# Altium schematic sheet GNSS_ZED-X20P.SchDoc
size A4; DocumentNumber: 2; SheetNumber: 2; SheetTotal: 12
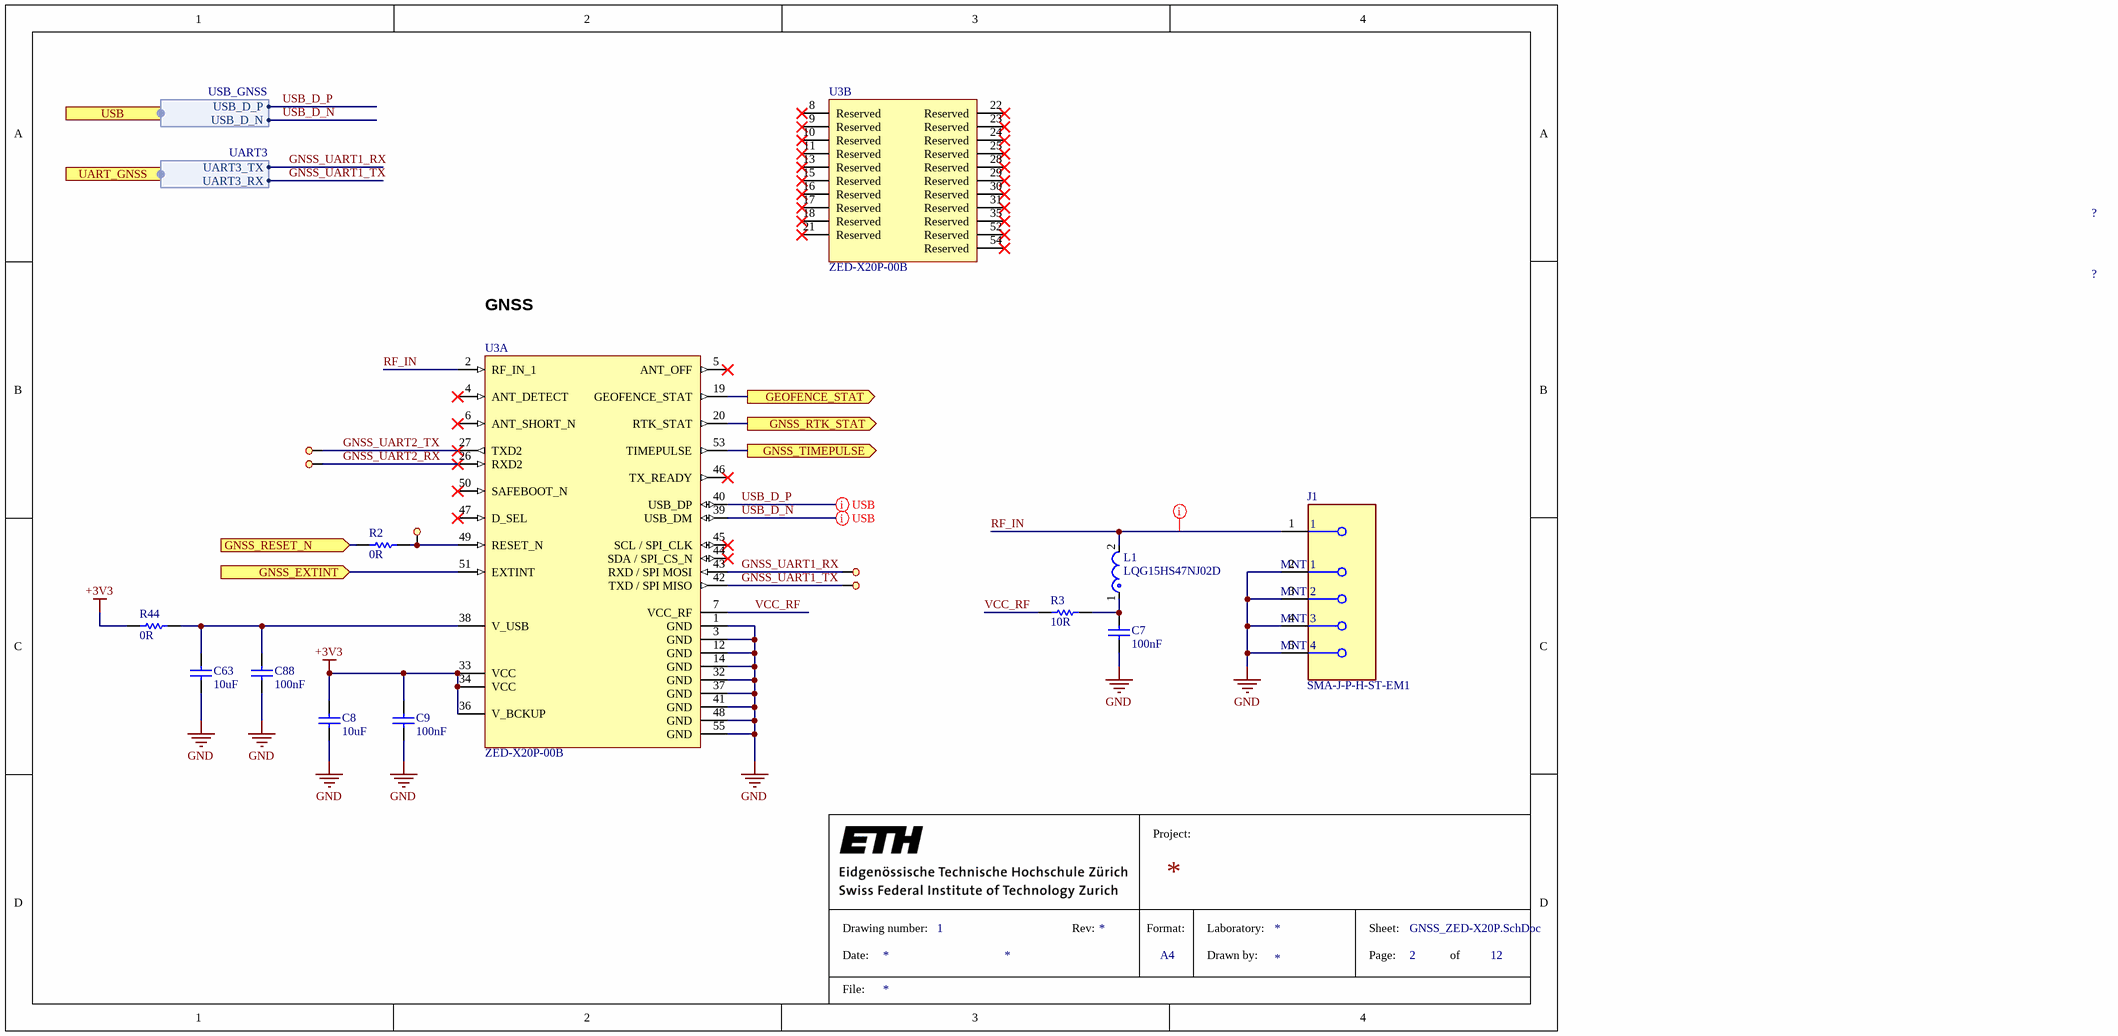
[diagram p0: GNSS_ZED-X20P.SchDoc]

## Parts
*7  testpoint  [testpoint]  (value not drawn)
*8  testpoint  [testpoint]  (value not drawn)
*10  testpoint  [testpoint]  (value not drawn)
*11  testpoint  [testpoint]  (value not drawn)
C7  100nF  [CAPC1005X55X25LL05T10]
C8  10uF  [FP-GRM188-0_2-IPC_C]
C9  100nF  [CAPC1005X55X25LL05T10]
C63  10uF  [FP-GRM188-0_2-IPC_C]
C88  100nF  [CAPC1005X55X25LL05T10]
J1  SMA-J-P-H-ST-EM1  [FP-SMA-J-P-H-ST-EM1-MFG]
L1  LQG15HS47NJ02D  [FP-LQG15HH_02-IPC_B]
r  testpoint  [testpoint]  (value not drawn)
R2  0R  [RESC1005X40X25LL05T10]
R3  10R  [RESC1608X55X25NL10T15]
R44  0R  [RESC1005X40X25LL05T10]
U3  ZED-X20P-00B  [ZED-F9P]  (parts A,B of 2)

## Ports
GEOFENCE_STAT (out, see MAIN[6B], IndicatorLEDs[2A], MCU[1B]), GNSS_EXTINT (in, see MAIN[6B], MCU[1A]), GNSS_RESET_N (in, see MAIN[6B], MCU[1A]), GNSS_RTK_STAT (out, see MAIN[6B], IndicatorLEDs[2A], MCU[1B]), GNSS_TIMEPULSE (out, see MAIN[6B], MCU[1B]), UART_GNSS (harness UART3, see MAIN[6B], MCU[1A]), USB (harness USB_GNSS, see MAIN[6C], USB_C_GNSS[4B])

## Harnesses
USB_GNSS: USB_D_P, USB_D_N
UART3: UART3_TX, UART3_RX

## Nets
+3V3: C8.2 C9.2 R44.2 U3.33(VCC) U3.34(VCC) U3.36(V_BCKUP)
GND: C7.1 C8.1 C9.1 C63.1 C88.1 J1.2(MNT_1) J1.3(MNT_2) J1.4(MNT_3) J1.5(MNT_4) U3.1(GND) U3.3(GND) U3.12(GND) U3.14(GND) U3.32(GND) U3.37(GND) U3.41(GND) U3.48(GND) U3.55(GND)
GEOFENCE_STAT: U3.19(GEOFENCE_STAT) ; port GEOFENCE_STAT
GNSS_EXTINT: U3.51(EXTINT) ; port GNSS_EXTINT
GNSS_RESET_N: R2.1 ; port GNSS_RESET_N
GNSS_RTK_STAT: U3.20(RTK_STAT) ; port GNSS_RTK_STAT
GNSS_TIMEPULSE: U3.53(TIMEPULSE) ; port GNSS_TIMEPULSE
GNSS_UART1_RX: *10.1 U3.43(RXD_/_SPI_MOSI) ; port UART_GNSS.UART3_TX
GNSS_UART1_TX: *11.1 U3.42(TXD_/_SPI_MISO) ; port UART_GNSS.UART3_RX
GNSS_UART2_RX: *8.1 U3.26(RXD2)
GNSS_UART2_TX: *7.1 U3.27(TXD2)
RF_IN: J1.1 L1.2 U3.2(RF_IN_1)
USB_D_N: U3.39(USB_DM) ; port USB.USB_D_N
USB_D_P: U3.40(USB_DP) ; port USB.USB_D_P
VCC_RF: R3.2 U3.7(VCC_RF)
NetC7_2: C7.2 L1.1 R3.1
NetC63_2: C63.2 C88.2 R44.1 U3.38(V_USB)
Netr_1: r.1 R2.2 U3.49(RESET_N)

Not connected (* = marked no-connect by the designer): U3 4(ANT_DETECT)* 5(ANT_OFF)* 6(ANT_SHORT_N)* 8(Reserved)* 9(Reserved)* 10(Reserved)* 11(Reserved)* 13(Reserved)* 15(Reserved)* 16(Reserved)* 17(Reserved)* 18(Reserved)* 21(Reserved)* 22(Reserved)* 23(Reserved)* 24(Reserved)* 25(Reserved)* 28(Reserved)* 29(Reserved)* 30(Reserved)* 31(Reserved)* 35(Reserved)* 44(SDA_/_SPI_CS_N)* 45(SCL_/_SPI_CLK)* 46(TX_READY)* 47(D_SEL)* 50(SAFEBOOT_N)* 52(Reserved)* 54(Reserved)*

## Layout directives
Parameter 1: 50R; net class SE_50R: RF_IN
differential pair; differential pair class USB_90R; rule Matched Net Lengths [Tolerance = 100mil]; net class USB_90R: USB_D_N, USB_D_P

## Notes on the sheet
- ?
- GNSS
- Project:
- Drawing number:
- Date:
- 1
- Rev:
- Format:
- A4
- Laboratory:
- Drawn by:
- Sheet:
- Page:
- of
- File:

## Library data of the parts
C7 C9 C88 = CMP-2008-03928-1: Manufacturer: Murata; Part Number: GRM155R71C104KA88J; Tolerance: 10%; Value: 100nF; Manufacturer Part Number: GRM155R71C104KA88J
C8 C63 = GRM188R61E106MA73D: CAP CER 10UF 25V X5R 0603; Manufacturer: Murata; Tolerance: 20%; Supplier: Digi-Key; Supplier Part Number: 490-7202-6-ND; Manufacturer Part Number: GRM188R61E106MA73D; RoHS: Yes; Category: Ceramic Capacitors; Stock: 3353344; Pricing: 1=0.26, 10=0.176, 50=0.1176, 100=0.0999, 500=0.07054, 1000=0.06173 (USD); ComponentLink1URL: https://datasheet.ciiva.com/14906/partnumbering-e-01-14906429.pdf?src-supplier=Digi-Key; ComponentLink1Description: https://datasheet.ciiva.com/14906/partnumbering-e-01-14906429.pdf?src-supplier=Digi-Key; ComponentLink2URL: https://datasheet.ciiva.com/14906/partnumbering-e-01-14906431.pdf?src-supplier=Digi-Key; ComponentLink2Description: https://datasheet.ciiva.com/14906/partnumbering-e-01-14906431.pdf?src-supplier=Digi-Key; ComponentLink3URL: https://datasheet.ciiva.com/22776/608985-22776426.pdf?src-supplier=Farnell; ComponentLink3Description: https://datasheet.ciiva.com/22776/608985-22776426.pdf?src-supplier=Farnell; ComponentLink4URL: https://datasheet.ciiva.com/22776/c02e-22776427.pdf?src-supplier=Farnell; ComponentLink4Description: https://datasheet.ciiva.com/22776/c02e-22776427.pdf?src-supplier=Farnell; ComponentLink5URL: https://datasheet.ciiva.com/22619/c02e-22619674.pdf?src-supplier=Element14; ComponentLink5Description: https://datasheet.ciiva.com/22619/c02e-22619674.pdf?src-supplier=Element14; Value: 10uF
J1 = CMP-02754-000006-1: CONN SMA JACK STR 50OHM EDGE MNT; Dielectric Material: PTFE; Center Contact Plating: Gold; Max Frequency: 6GHz; Body Material: Brass; Voltage Rating: 335V; Impedance: 50R; Package Quantity: 1; Case/Package: SMA; Max Operating Temperature: 125°C; Fastening Type: Threaded; Orientation: Straight; Depth: 13.33mm; RoHS Compliant: Yes; Length: 6.35mm; Insulation Material: Polytetrafluoroethylene; Termination: Solder; Min Operating Temperature: -65°C; Housing Color: Gold; Contact Plating: Gold; Contact Material: Copper; Connector Type: SMA; Mount: Edge; Series: SMA; Packaging: Tray; Body Plating: Gold; Radiation Hardening: No; Supplier: Avnet; Supplier Part Number: SMA-J-P-H-ST-EM1
L1 = CMP-06042-015783-1: Multilayer type RF Inductor 47nH ±5% 0.72Ω 300mA 0402; Manufacturer: Murata; Core Material: Air; DC Resistance (DCR): 720mR; DC Current: 200mA; Shielding: Unshielded; Self Resonant Frequency: 1GHz; Q Factor: 8; Test Frequency: 100MHz; Tolerance: 5%; Packaging: Tape and Reel; Case Code (Imperial): 0402; Max Operating Temperature: 125°C; Military Standard: Not; Length: 1mm; Radiation Hardening: No; Height: 0.5mm; Min Operating Temperature: -55°C; Width: 0.02inch; Value: 47nH; Lead Free: Lead Free; Termination: SMD/SMT; Height - Seated (Max): 0.022inch; Rated Current-Max: 200mA; Case/Package: 0402; Max DC Current: 200mA; Series: LQG15HS; Case Code (Metric): 1005; Mount: Surface Mount; Current Rating: 200mA; Depth: 0.55mm; Package Quantity: 1; Supplier: Digikey; Supplier Part Number: 490-2631-6-ND; Manufacturer Part Number: LQG15HS47NJ02D; RoHS: Yes; Category: Fixed Inductors; Stock: 40426; Pricing: 1=0.1, 10=0.049, 25=0.0448, 50=0.0396, 100=0.0346, 250=0.03296, 500=0.03098, 1000=0.02373, 2500=0.02241 (USD); RMS Current (Irms): 300mA; ESR: 720mR; ComponentLink1URL: https://datasheet.ciiva.com/11799/0900766b8090d685-11799071.pdf?src-supplier=Rs; ComponentLink1Description: https://datasheet.ciiva.com/11799/0900766b8090d685-11799071.pdf?src-supplier=Rs; ComponentLink2URL: https://datasheet.ciiva.com/18088/getdatasheetpartid-55809-18088839.pdf?src-supplier=Verical; ComponentLink2Description: https://datasheet.ciiva.com/18088/getdatasheetpartid-55809-18088839.pdf?src-supplier=Verical; ComponentLink3URL: https://datasheet.ciiva.com/1038/l0075s0083lqg15hs-1038337.pdf?src-supplier=Digikey; ComponentLink3Description: https://datasheet.ciiva.com/1038/l0075s0083lqg15hs-1038337.pdf?src-supplier=Digikey; ComponentLink4URL: https://datasheet.ciiva.com/1038/l0075s0083lqg15hs-1038338.pdf?src-supplier=Digikey; ComponentLink4Description: https://datasheet.ciiva.com/1038/l0075s0083lqg15hs-1038338.pdf?src-supplier=Digikey; ComponentLink5URL: https://datasheet.ciiva.com/1038/l0075s0083lqg15hs-1038339.pdf?src-supplier=Digikey; ComponentLink5Description: https://datasheet.ciiva.com/1038/l0075s0083lqg15hs-1038339.pdf?src-supplier=Digikey; ComponentLink6URL: https://datasheet.ciiva.com/4977/o05e-4977919.pdf?src-supplier=Mouser; ComponentLink6Description: https://datasheet.ciiva.com/4977/o05e-4977919.pdf?src-supplier=Mouser
R2 R44 = CMP-2002-03041-1: Resistor 0R 0402; Part Number: CRCW04020000Z0EDHP; Manufacturer: Vishay Dale; Value: 0Ohm; Voltage Rating: 50V; Power Rating: 200mW; Temperature Coefficient: 0ppm/°C; Max Power Dissipation: 125mW; Supplier 1: Digi-Key; Supplier Part Number 1: 541-0.0YBCT-ND; Manufacturer Part Number: CRCW04020000Z0EDHP; RoHS: Yes; Category: Chip SMD Resistors; Stock 1: 527407; Pricing 1: 1=0.13000, 10=0.11300, 25=0.07840, 50=0.06080, 100=0.04350, 250=0.03388, 500=0.02694, 1000=0.01912, 5000=0.01477 (USD); Mount: Surface Mount; Case/Package: 0402; Weight: 2.3E-05oz; Case Code (Metric): 1005; Case Code (Imperial): 0402; Contact Plating: Tin; Min Operating Temperature: -55°C; Max Operating Temperature: 155°C; Packaging: Tape and Reel; Composition: Thick Film; Termination: SMD/SMT; Voltage Rating (DC): 50V; Package Quantity: 1; Military Standard: Not; Number of Terminations: 2; Features: Automotive AEC-Q200; Length: 1mm; Height: 0.3mm; Width: 0.02inch; Depth: 0.5mm; Radiation Hardening: No; REACH SVHC: Unknown; Lead Free: Lead Free; ComponentLink1URL: https://datasheet.ciiva.com/16494/crcwhpe3-16494453.pdf?src-supplier=Future+Electronics; ComponentLink1Description: https://datasheet.ciiva.com/16494/crcwhpe3-16494453.pdf?src-supplier=Future+Electronics; ComponentLink2URL: https://datasheet.ciiva.com/2470/crcwhpe3-2470555.pdf?src-supplier=Digi-Key; ComponentLink2Description: https://datasheet.ciiva.com/2470/crcwhpe3-2470555.pdf?src-supplier=Digi-Key; ComponentLink3URL: https://datasheet.ciiva.com/5562/crcwhpe3-46056-5562315.pdf?src-supplier=Mouser; ComponentLink3Description: https://datasheet.ciiva.com/5562/crcwhpe3-46056-5562315.pdf?src-supplier=Mouser; ComponentLink4URL: https://datasheet.ciiva.com/9109/crcwhpe3-9109963.pdf?src-supplier=Avnet; ComponentLink4Description: https://datasheet.ciiva.com/9109/crcwhpe3-9109963.pdf?src-supplier=Avnet; ComponentLink5URL: https://datasheet.ciiva.com/2470/crcwhpe3-2470556.pdf?src-supplier=Digi-Key; ComponentLink5Description: https://datasheet.ciiva.com/2470/crcwhpe3-2470556.pdf?src-supplier=Digi-Key; ComponentLink6URL: https://datasheet.ciiva.com/28621/1912814-28621324.pdf?src-supplier=Element14; ComponentLink6Description: https://datasheet.ciiva.com/28621/1912814-28621324.pdf?src-supplier=Element14; ComponentLink7URL: https://datasheet.ciiva.com/2470/crcwhpe3-2470557.pdf?src-supplier=Digi-Key; ComponentLink7Description: https://datasheet.ciiva.com/2470/crcwhpe3-2470557.pdf?src-supplier=Digi-Key; ComponentLink8URL: https://datasheet.ciiva.com/7725/crcwhpe3-7725758.pdf?src-supplier=Element14; ComponentLink8Description: https://datasheet.ciiva.com/7725/crcwhpe3-7725758.pdf?src-supplier=Element14
R3 = CMP-1659-00008-4: Chip Resistor, 10 Ohm, +/- 1%, 0.1 W, -55 to 155 degC, 0603 (1608 Metric), RoHS, Tape and Reel; Manufacturer: Yageo; Manufacturer Part Number: CR0603-FX-10R0ELF; Voltage Rating: 50 V; Value: 10Ohm; Temperature Coefficient: 100ppm/°C; Voltage Rating (DC): 50V; Power Rating: 100mW; PackageReference: 0603; ComponentLink3Description: Package Specification; Packaging: Tape and Reel; Max Operating Temperature: 155 degC; ComponentLink3URL: http://www.farnell.com/datasheets/443971.pdf; PackageDescription: 2-Pin Surface Mount Device, Body 1.6 x 0.8 mm; ComponentLink1URL: http://www.yageo.com/; Pins: 2; REACH SVHC: No SVHC; RoHSCompliant: true; ComponentLink2URL: http://www.yageo.com/documents/recent/PYu-RC_Group_51_RoHS_L_04.pdf; DatasheetVersion: Rev. 4, 02/2016; Mount: Surface Mount; Package Quantity: 200; Min Operating Temperature: -55 degC; Height: 0.45 mm; Mounting Technology: Surface Mount; ComponentLink1Description: Manufacturer URL; ComponentLink2Description: Datasheet; Length: 1.6 mm; Supplier: Digikey; Supplier Part Number: CR0603-FX-10R0ELFCT-ND; RoHS: Yes; Category: Chip SMD Resistors; Stock: 259694; Pricing: 1=0.1, 10=0.015, 50=0.009, 100=0.0075, 500=0.00498, 1000=0.00425 (USD); Case/Package: 0603; Case Code (Imperial): 0603; Case Code (Metric): 1608; Contact Plating: Tin; Tolerance: 1%; Series: CR0603; Termination: SMD/SMT; Resistance Tolerance: 1%; Resistor Type: Thick Film; Number of Terminations: 2; Max Power Dissipation: 100mW; Features: Moisture Resistant; Technology: THICK FILM; Width: 0.8mm; Depth: 0.8mm; Thickness: 457um; Radiation Hardening: No; RoHS Compliant: Yes; Reach SVHC Compliant: No; ComponentLink4URL: https://datasheet.ciiva.com/11808/0900766b80fcdb72-11808034.pdf?src-supplier=Rs; ComponentLink4Description: https://datasheet.ciiva.com/11808/0900766b80fcdb72-11808034.pdf?src-supplier=Rs; ComponentLink5URL: https://datasheet.ciiva.com/41449/001055487-da-01-en-smd-wid-cr0603-fx-10r0elf-10-ohm-1-10w-41449967.pdf?src-supplier=Conrad; ComponentLink5Description: https://datasheet.ciiva.com/41449/001055487-da-01-en-smd-wid-cr0603-fx-10r0elf-10-ohm-1-10w-41449967.pdf?src-supplier=Conrad; ComponentLink6URL: https://datasheet.ciiva.com/7001/1902866-7001627.pdf?src-supplier=Newark; ComponentLink6Description: https://datasheet.ciiva.com/7001/1902866-7001627.pdf?src-supplier=Newark; ComponentLink7URL: https://datasheet.ciiva.com/5549/chpreztr-26488-5549959.pdf?src-supplier=Mouser; ComponentLink7Description: https://datasheet.ciiva.com/5549/chpreztr-26488-5549959.pdf?src-supplier=Mouser; ComponentLink8URL: https://datasheet.ciiva.com/7986/1902866-7986159.pdf?src-supplier=Element14; ComponentLink8Description: https://datasheet.ciiva.com/7986/1902866-7986159.pdf?src-supplier=Element14; ComponentLink9URL: https://datasheet.ciiva.com/22713/691949-22713210.pdf?src-supplier=Element14; ComponentLink9Description: https://datasheet.ciiva.com/22713/691949-22713210.pdf?src-supplier=Element14; ComponentLink10URL: https://datasheet.ciiva.com/46383/1791942-46383781.pdf?src-supplier=Element14; ComponentLink10Description: https://datasheet.ciiva.com/46383/1791942-46383781.pdf?src-supplier=Element14
U3 = ZED-X20P-00B: u-blox X20 all-band GNSS High Precision module LGA, 250 pcs/reel; Frequency: 1.2276GHz, 1.575GHz; Sensitivity: -167dBm; Data Rate (Max): 921.6kbps; Modulation or Protocol: BeiDou, Galileo, GLONASS, GNSS, GPS; Data Interface: I²C, SPI, UART, USB; Voltage - Supply: 2.7V ~ 3.6V; Applications: General Purpose; Current - Receiving: -; Memory Size: -; Antenna Connector: -; Features: -; Operating Temperature: -40°C ~ 85°C; Mounting Type: Surface Mount; Package / Case: 54-SMD Module; Supplier Device Package: 54-LGA (22x17); Supplier: DigiKey; Supplier Part Number: 672-ZED-X20P-00BCT-ND; Manufacturer Part Number: ZED-X20P-00B; RoHS: Compliant; Category: RF Receivers, Transceivers; Stock: 250; Pricing: 1=177.3 (USD); Introduction Date: 2025-05-22; Lifecycle Status: Production; REACH SVHC: Yes